# Altium project Custom_Keyboard.PrjPcb (part 1 of 4)
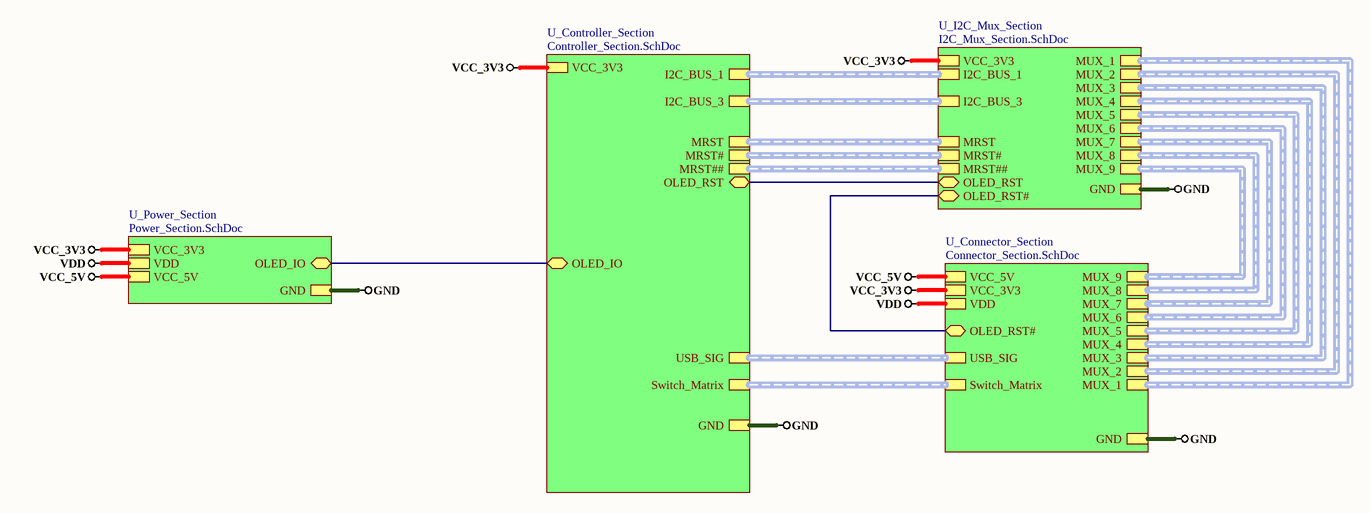
[diagram p0: Top_Sheet.SchDoc]
15 sheets, 298 parts. Net scope: hierarchical (ports join the sheet entries above them; power ports are global).
Board file: Custom_Keyboard.PcbDoc
Sheets:
  Top_Sheet.SchDoc
    U_Controller_Section = Controller_Section.SchDoc
      U_Controller_Section_1 = Controller_Section_1.SchDoc
      U_Controller_Section_2 = Controller_Section_2.SchDoc
    U_Power_Section = Power_Section.SchDoc
    U_Connector_Section = Connector_Section.SchDoc
      U_Connector_Sheet = Connector_Sheet.SchDoc
      U_Connector_Sheet_2 = Connector_Sheet_2.SchDoc
    U_I2C_Mux_Section = I2C_Mux_Section.SchDoc
      U_Mux_Sheet_1 = Mux_Sheet_1.SchDoc
      U_Mux_Sheet_2 = Mux_Sheet_2.SchDoc
      U_RPull_Section = RPull_Section.SchDoc
      U_Rpull_Section2 = Rpull_Section2.SchDoc
      U_Mux_Sheet _3 = Mux_Sheet _3.SchDoc
      U_BufferIC_Section = BufferIC_Section.SchDoc

## Sheet Top_Sheet.SchDoc
size A4; SheetNumber: 1

### Sub-sheets
U_Connector_Section = Connector_Section.SchDoc: USB_SIG (harness USB_SIG), GND, VCC_5V, MUX_1 (harness MUX_1), MUX_2 (harness MUX_2), MUX_3 (harness MUX_3), MUX_4 (harness MUX_4), MUX_5 (harness MUX_5), Switch_Matrix (harness Switch_Matrix), VCC_3V3, VDD, MUX_6 (harness MUX_6), MUX_7 (harness MUX_7), MUX_8 (harness MUX_8), MUX_9 (harness MUX_9), OLED_RST# (bidir)
U_Controller_Section = Controller_Section.SchDoc: USB_SIG (harness USB_SIG), VCC_3V3, GND, I2C_BUS_1 (harness I2C_BUS_1), I2C_BUS_3 (harness I2C_BUS_3), Switch_Matrix (harness Switch_Matrix), OLED_IO (bidir), MRST (harness MRST), MRST# (harness MRST#), MRST## (harness MRST##), OLED_RST (bidir)
U_I2C_Mux_Section = I2C_Mux_Section.SchDoc: VCC_3V3, GND, I2C_BUS_1 (harness I2C_BUS_1), I2C_BUS_3 (harness I2C_BUS_3), MUX_1 (harness MUX_1), MUX_2 (harness MUX_2), MUX_3 (harness MUX_3), MUX_4 (harness MUX_4), MUX_5 (harness MUX_5), MUX_6 (harness MUX_6), MUX_7 (harness MUX_7), MUX_8 (harness MUX_8), MUX_9 (harness MUX_9), MRST (harness MRST), MRST# (harness MRST#), MRST## (harness MRST##), OLED_RST (bidir), OLED_RST# (bidir)
U_Power_Section = Power_Section.SchDoc: VCC_3V3, GND, VCC_5V, OLED_IO (bidir), VDD

### Nets
GND: sheet U_Controller_Section/GND, sheet U_Power_Section/GND, sheet U_Connector_Section/GND, sheet U_I2C_Mux_Section/GND
VCC_3V3: sheet U_Controller_Section/VCC_3V3, sheet U_Power_Section/VCC_3V3, sheet U_Connector_Section/VCC_3V3, sheet U_I2C_Mux_Section/VCC_3V3
VCC_5V: sheet U_Power_Section/VCC_5V, sheet U_Connector_Section/VCC_5V
VDD: sheet U_Power_Section/VDD, sheet U_Connector_Section/VDD
OLED_IO: sheet U_Controller_Section/OLED_IO, sheet U_Power_Section/OLED_IO
OLED_RST: sheet U_Controller_Section/OLED_RST, sheet U_I2C_Mux_Section/OLED_RST
OLED_RST#: sheet U_Connector_Section/OLED_RST#, sheet U_I2C_Mux_Section/OLED_RST#

### Buses and harness runs
harness sheet U_Connector_Section/MUX_1 = sheet U_I2C_Mux_Section/MUX_1
harness sheet U_Connector_Section/MUX_2 = sheet U_I2C_Mux_Section/MUX_2
harness sheet U_Connector_Section/MUX_3 = sheet U_I2C_Mux_Section/MUX_3
harness sheet U_Connector_Section/MUX_4 = sheet U_I2C_Mux_Section/MUX_4
harness sheet U_Connector_Section/MUX_5 = sheet U_I2C_Mux_Section/MUX_5
harness sheet U_Connector_Section/MUX_6 = sheet U_I2C_Mux_Section/MUX_6
harness sheet U_Connector_Section/MUX_7 = sheet U_I2C_Mux_Section/MUX_7
harness sheet U_Connector_Section/MUX_8 = sheet U_I2C_Mux_Section/MUX_8
harness sheet U_Connector_Section/MUX_9 = sheet U_I2C_Mux_Section/MUX_9
harness sheet U_Connector_Section/Switch_Matrix = sheet U_Controller_Section/Switch_Matrix
harness sheet U_Connector_Section/USB_SIG = sheet U_Controller_Section/USB_SIG
harness sheet U_Controller_Section/I2C_BUS_1 = sheet U_I2C_Mux_Section/I2C_BUS_1
harness sheet U_Controller_Section/I2C_BUS_3 = sheet U_I2C_Mux_Section/I2C_BUS_3
harness sheet U_Controller_Section/MRST = sheet U_I2C_Mux_Section/MRST
harness sheet U_Controller_Section/MRST# = sheet U_I2C_Mux_Section/MRST#
harness sheet U_Controller_Section/MRST## = sheet U_I2C_Mux_Section/MRST##

### Notes on the sheet
- 1
- Huzaifa Ali

## Sheet Controller_Section.SchDoc
size A4; SheetNumber: 4
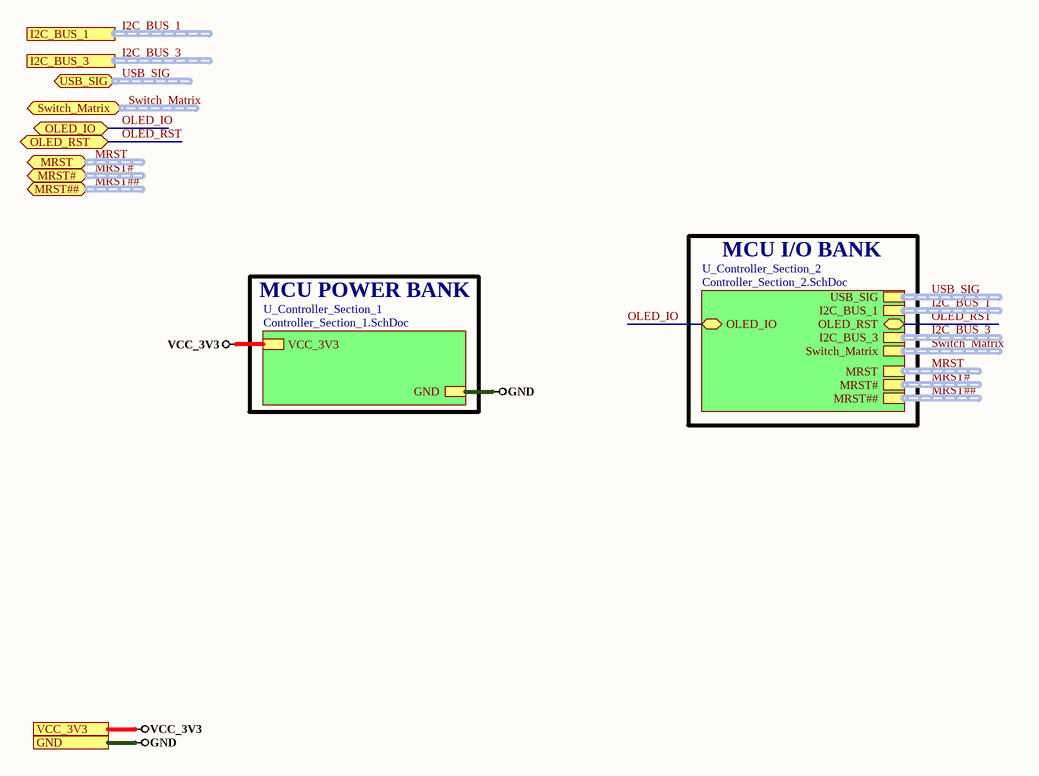
[diagram p1: Controller_Section.SchDoc]

### Sub-sheets
U_Controller_Section_1 = Controller_Section_1.SchDoc: VCC_3V3, GND
U_Controller_Section_2 = Controller_Section_2.SchDoc: USB_SIG (harness USB_SIG), I2C_BUS_1 (harness I2C_BUS_1), I2C_BUS_3 (harness I2C_BUS_3), Switch_Matrix (harness Switch_Matrix), OLED_IO (bidir), MRST (harness MRST), MRST# (harness MRST#), MRST## (harness MRST##), OLED_RST (bidir)

### Ports
GND, I2C_BUS_1 (harness I2C_BUS_1), I2C_BUS_3 (harness I2C_BUS_3), MRST (bidir, harness MRST), MRST# (bidir, harness MRST#), MRST## (bidir, harness MRST##), OLED_IO (bidir), OLED_RST (bidir), Switch_Matrix (bidir, harness Switch_Matrix), USB_SIG (bidir, harness USB_SIG), VCC_3V3

### Nets
GND: port GND, sheet U_Controller_Section_1/GND
VCC_3V3: port VCC_3V3, sheet U_Controller_Section_1/VCC_3V3
OLED_IO: port OLED_IO, sheet U_Controller_Section_2/OLED_IO
OLED_RST: port OLED_RST, sheet U_Controller_Section_2/OLED_RST

### Buses and harness runs
harness I2C_BUS_1 = port I2C_BUS_1
harness I2C_BUS_1 = sheet U_Controller_Section_2/I2C_BUS_1
harness I2C_BUS_3 = port I2C_BUS_3
harness I2C_BUS_3 = sheet U_Controller_Section_2/I2C_BUS_3
harness MRST = port MRST
harness MRST = sheet U_Controller_Section_2/MRST
harness MRST# = port MRST#
harness MRST# = sheet U_Controller_Section_2/MRST#
harness MRST## = port MRST##
harness MRST## = sheet U_Controller_Section_2/MRST##
harness Switch_Matrix = port Switch_Matrix
harness Switch_Matrix = sheet U_Controller_Section_2/Switch_Matrix
harness USB_SIG = port USB_SIG
harness USB_SIG = sheet U_Controller_Section_2/USB_SIG

### Notes on the sheet
- MCU I/O BANK
- MCU POWER BANK
- 1
- Huzaifa Ali

## Sheet Controller_Section_1.SchDoc
size A4; SheetNumber: 3
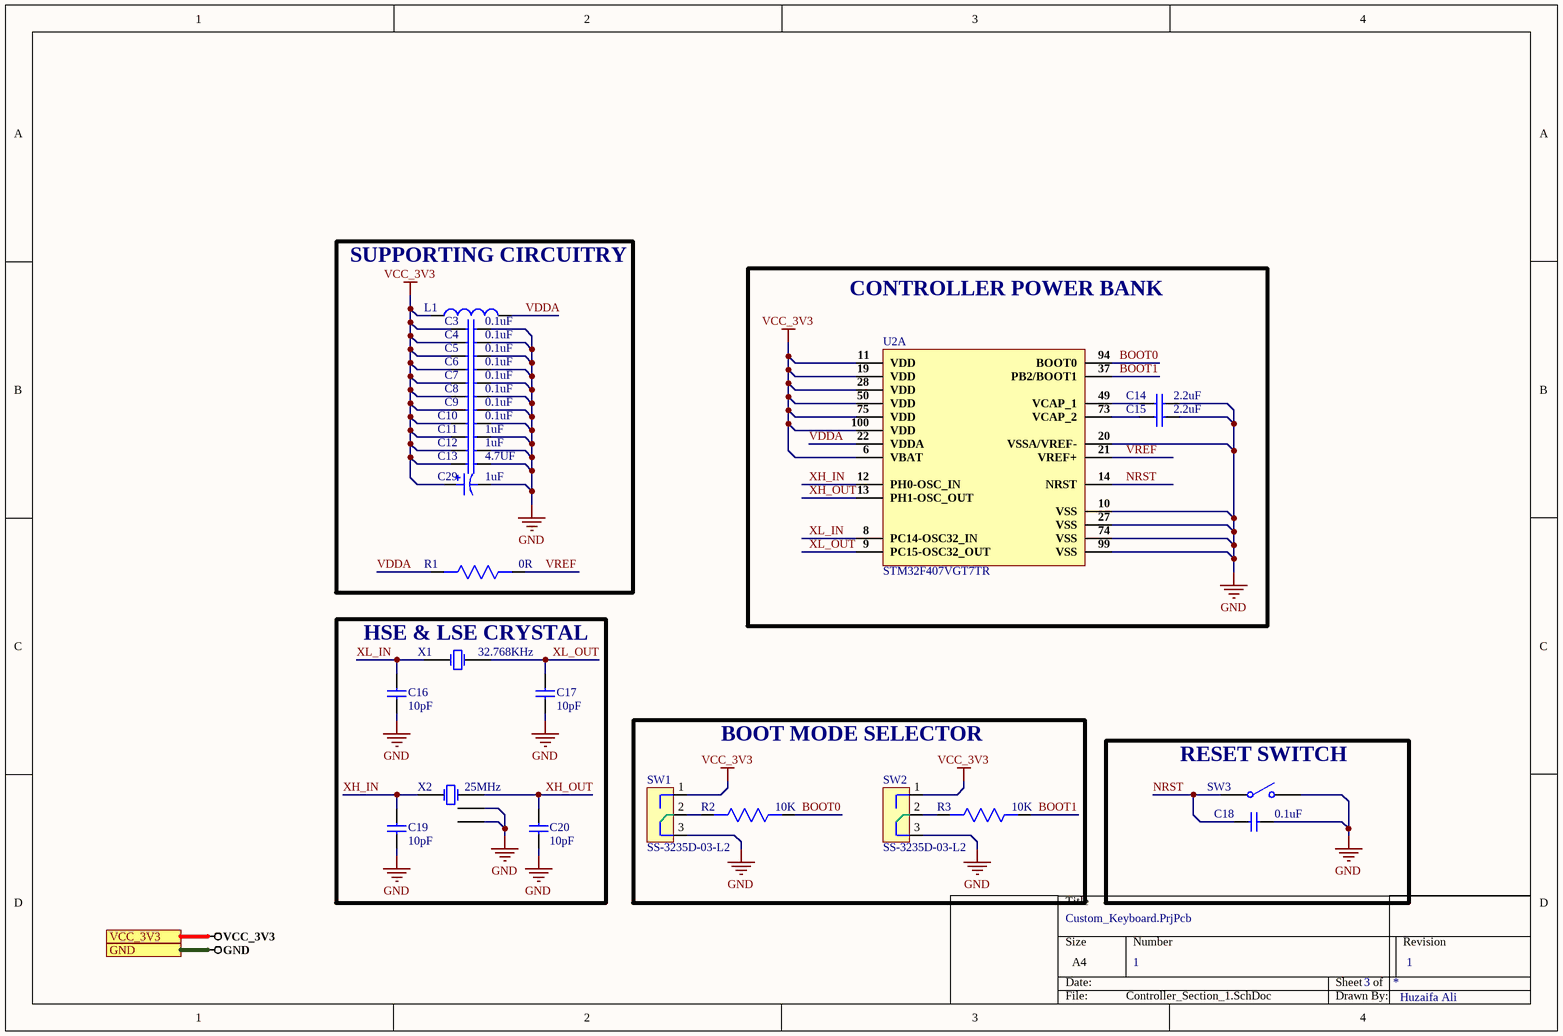
[diagram p2: Controller_Section_1.SchDoc]

### Parts
C3  0.1uF  [Cap0603]
C4  0.1uF  [Cap0603]
C5  0.1uF  [Cap0603]
C6  0.1uF  [Cap0603]
C7  0.1uF  [Cap0603]
C8  0.1uF  [Cap0603]
C9  0.1uF  [Cap0603]
C10  0.1uF  [Cap0603]
C11  1uF  [Cap0603]
C12  1uF  [Cap0603]
C13  4.7UF  [Cap0603]
C14  2.2uF  [Cap0603]
C15  2.2uF  [Cap0603]
C16  10pF  [Cap0603]
C17  10pF  [Cap0603]
C18  0.1uF  [Cap0603]
C19  10pF  [Cap0603]
C20  10pF  [Cap0603]
C29  1uF  [F981E105MMA]
L1  FBMH1608HL121-TV  [IND 0603]  (value not drawn)
R1  0R  [Res-0201]
R2  10K  [Res0603]
R3  10K  [Res0603]
SW1  SS-3235D-03-L2  [SS-3235D-03-L2]
SW2  SS-3235D-03-L2  [SS-3235D-03-L2]
SW3  TS-1185EC-C-D-B  [TS-1185EC-C-D-B]  (value not drawn)
U2  STM32F407VGT7TR  [LQFP-100]  (part A of 4)
X1  32.768KHz  [Q13FC1350000200]
X2  25MHz  [S3225000101040]

### Blocks framed on the sheet
SUPPORTING CIRCUITRY: C3-C13 C29 L1 R1
CONTROLLER POWER BANK: C14 C15 U2
HSE & LSE CRYSTAL: C16 C17 C19 C20 X1 X2
BOOT MODE SELECTOR: R2 R3 SW1 SW2
RESET SWITCH: C18 SW3

### Ports
GND, VCC_3V3

### Nets
GND: C3.2 C4.2 C5.2 C6.2 C7.2 C8.2 C9.2 C10.2 C11.2 C12.2 C13.2 C14.2 C15.2 C16.1 C17.1 C18.2 C19.1 C20.1 C29.2 SW1.3(+) SW2.3(+) SW3.2 U2.10(VSS) U2.20(VSSA/VREF-) U2.27(VSS) U2.74(VSS) U2.99(VSS) X2.2(GND) X2.4(GND) ; port GND
VCC_3V3: C3.1 C4.1 C5.1 C6.1 C7.1 C8.1 C9.1 C10.1 C11.1 C12.1 C13.1 C29.1 L1.1 SW1.1(+) SW2.1(+) U2.6(VBAT) U2.11(VDD) U2.19(VDD) U2.28(VDD) U2.50(VDD) U2.75(VDD) U2.100(VDD) ; port VCC_3V3
BOOT0: R2.1 U2.94(BOOT0)
BOOT1: R3.1 U2.37(PB2/BOOT1)
NRST: C18.1 SW3.1 U2.14(NRST)
VDDA: L1.2 R1.2 U2.22(VDDA)
VREF: R1.1 U2.21(VREF+)
XH_IN: C19.2 U2.12(PH0-OSC_IN) X2.1(OSC1)
XH_OUT: C20.2 U2.13(PH1-OSC_OUT) X2.3(OSC3)
XL_IN: C16.2 U2.8(PC14-OSC32_IN) X1.1(OSC1)
XL_OUT: C17.2 U2.9(PC15-OSC32_OUT) X1.2(OSC2)
NetC14_1: C14.1 U2.49(VCAP_1)
NetC15_1: C15.1 U2.73(VCAP_2)
NetR2_2: R2.2 SW1.2(+)
NetR3_2: R3.2 SW2.2(+)

### Notes on the sheet
- 1
- Huzaifa Ali

### Library data of the parts
C3-C10 C18 = CC0603ZRY5V9BB104: CAP CER 0.1UF 50V Y5V 0603; Manufacturer: Yageo; Capacitance: 100nF; Tolerance: 80%; Supplier 1: Digi-Key; Manufacturer Part Number: CC0603ZRY5V9BB104; Stock 1: 15000880; Pricing 1: 1=0.1, 10=0.075, 100=0.0334, 500=0.02386, 1000=0.01874 (USD); Mount: Surface Mount; Case/Package: 0603; Number of Pins: 2; Case Code (Metric): 1608; Case Code (Imperial): 0603; Min Operating Temperature: -30°C; Max Operating Temperature: 85°C; Dielectric: Y5V; Voltage Rating: 50V; Package Quantity: 1; Packaging: Tape and Reel; Voltage Rating (DC): 50V; Termination: SMD/SMT; Composition: Ceramic; Voltage: 50V; Length: 1.6mm; Height: 0.8mm; Width: 0.031inch; Thickness: 0.035inch; Depth: 0.8mm; Radiation Hardening: No; REACH SVHC: No SVHC; Lead Free: Lead Free; Halogen Free: Halogen Free; ComponentLink1URL: http://www.yageo.com/documents/recent/UPY-GPHC_Y5V_6.3V-to-50V_8.pdf?src-supplier=Digi-Key; ComponentLink1Description: http://www.yageo.com/documents/recent/UPY-GPHC_Y5V_6.3V-to-50V_8.pdf?src-supplier=Digi-Key; ComponentLink2URL: http://www.yageo.com/documents/recent/UPY-GPHC_Y5V_6.3V-to-50V_5.pdf?src-supplier=Avnet+Europe; ComponentLink2Description: http://www.yageo.com/documents/recent/UPY-GPHC_Y5V_6.3V-to-50V_5.pdf?src-supplier=Avnet+Europe; ComponentLink3URL: https://www.verical.com/server-webapp/html/getDatasheet?partID=403611&src-supplier=Verical; ComponentLink3Description: https://www.verical.com/server-webapp/html/getDatasheet?partID=403611&src-supplier=Verical; ComponentLink4URL: http://www.mouser.com/ds/2/447/Yageo_UPY-GP_NP0_16V-to-50V_9-358835.pdf?src-supplier=Mouser; ComponentLink4Description: http://www.mouser.com/ds/2/447/Yageo_UPY-GP_NP0_16V-to-50V_9-358835.pdf?src-supplier=Mouser; ComponentLink5URL: http://www.farnell.com/datasheets/1132289.pdf?src-supplier=Element14; ComponentLink5Description: http://www.farnell.com/datasheets/1132289.pdf?src-supplier=Element14; Supplier Part Number 1: 311-1343-1-ND
C11 C12 = CC0603KRX5R8BB105: CAP CER 1UF 25V X5R 0603; Manufacturer: Yageo; Tolerance: 10%; Supplier 1: Digi-Key; Manufacturer Part Number: CC0603KRX5R8BB105; RoHS: Yes; Category: Ceramic Capacitors; Stock 1: 919939; Pricing 1: 1=0.12000, 10=0.08400, 50=0.04760, 100=0.03940, 500=0.02764, 1000=0.02288 (USD); Mount: Surface Mount; Case/Package: 0603; Number of Pins: 2; Case Code (Metric): 1608; Case Code (Imperial): 0603; Min Operating Temperature: -55°C; Max Operating Temperature: 85°C; Capacitance: 1uF; Dielectric: X5R; Package Quantity: 1; Voltage Rating: 25V; Packaging: Tape and Reel; Termination: SMD/SMT; Voltage Rating (DC): 25V; Series: CC; Construction: Flat; Length: 1.6mm; Width: 0.031inch; Height: 0.8mm; Thickness: 0.035inch; Depth: 0.8mm; Radiation Hardening: No; REACH SVHC: No SVHC; Lead Free: Lead Free; Halogen Free: Halogen Free; RoHS Compliant: Yes; ComponentLink1URL: https://datasheet.ciiva.com/176/mlccorderingcode-176785.pdf?src-supplier=Digi-Key; ComponentLink1Description: https://datasheet.ciiva.com/176/mlccorderingcode-176785.pdf?src-supplier=Digi-Key; ComponentLink2URL: https://datasheet.ciiva.com/176/mlccorderingcode-176786.pdf?src-supplier=Digi-Key; ComponentLink2Description: https://datasheet.ciiva.com/176/mlccorderingcode-176786.pdf?src-supplier=Digi-Key; ComponentLink3URL: https://datasheet.ciiva.com/176/mlccorderingcode-176787.pdf?src-supplier=Digi-Key; ComponentLink3Description: https://datasheet.ciiva.com/176/mlccorderingcode-176787.pdf?src-supplier=Digi-Key; ComponentLink4URL: https://datasheet.ciiva.com/17436/upy-gphc-x5r-4v-to-50v-12-17436952.pdf?src-supplier=Avnet+Europe; ComponentLink4Description: https://datasheet.ciiva.com/17436/upy-gphc-x5r-4v-to-50v-12-17436952.pdf?src-supplier=Avnet+Europe; ComponentLink5URL: https://datasheet.ciiva.com/7978/1525783-7978171.pdf?src-supplier=Element14; ComponentLink5Description: https://datasheet.ciiva.com/7978/1525783-7978171.pdf?src-supplier=Element14; ComponentLink6URL: https://datasheet.ciiva.com/11586/upy-gphc-x5r-4v-to-50v-12-11586318.pdf?src-supplier=Avnet; ComponentLink6Description: https://datasheet.ciiva.com/11586/upy-gphc-x5r-4v-to-50v-12-11586318.pdf?src-supplier=Avnet; Supplier Part Number 1: 311-1445-1-ND
C13 = CL10A475KA8NQNC: CAP CER 4.7UF 25V X5R 0603; Manufacturer: Samsung; Tolerance: 10%; Supplier 1: Digi-Key; Manufacturer Part Number: CL10A475KA8NQNC; Stock 1: 2252340; Pricing 1: 1=0.37, 10=0.255, 100=0.1528, 500=0.11456, 1000=0.09675 (USD); Mount: Surface Mount; Case/Package: 0603; Case Code (Metric): 1608; Case Code (Imperial): 0603; Contact Plating: Tin; Min Operating Temperature: -55°C; Max Operating Temperature: 85°C; Package Quantity: 1; Packaging: Tape and Reel; Capacitance: 4.7uF; Voltage Rating: 25V; Dielectric: X5R; Termination: Wraparound; Length: 1.6mm; Width: 0.031inch; Thickness: 0.035inch; Depth: 0.8mm; Lead Free: Lead Free; ComponentLink1URL: http://www.samsungsem.com/kr/support/product-search/mlcc/CL10A475KA8NQNC.jsp?src-supplier=Digi-Key; ComponentLink1Description: http://www.samsungsem.com/kr/support/product-search/mlcc/CL10A475KA8NQNC.jsp?src-supplier=Digi-Key; Supplier Part Number 1: 1276-1900-1-ND
C14 C15 = GRM188R6YA225KA12D: CAP, 2.2µF, 35V, 10%, X5R, 0603; Manufacturer: Murata; Material: Ceramic; Supplier 1: Digi-Key; Manufacturer Part Number: GRM188R6YA225KA12D; RoHS: Yes; Category: Ceramic Capacitors; Stock 1: 81665; Pricing 1: 1=0.21000, 10=0.14100, 50=0.08480, 100=0.07170, 500=0.04904, 1000=0.04338 (USD); Mount: Surface Mount; Case/Package: 0603; Case Code (Metric): 1608; Case Code (Imperial): 0603; Weight: 0.000222oz; Min Operating Temperature: -55°C; Max Operating Temperature: 85°C; Package Quantity: 4000; Packaging: Tape and Reel; Capacitance: 2.2uF; Tolerance: 10%; Voltage Rating: 35V; Dielectric: X5R; Voltage: 35V; Termination: SMD/SMT; Voltage Rating (DC): 35V; Series: GRM; Length: 1.6mm; Width: 0.8mm; Height: 0.8mm; Thickness: 0.035inch; Depth: 0.8mm; REACH SVHC: No SVHC; Lead Free: Lead Free; RoHS Compliant: Yes; ComponentLink1URL: https://datasheet.ciiva.com/14906/partnumbering-e-01-14906490.pdf?src-supplier=Digi-Key; ComponentLink1Description: https://datasheet.ciiva.com/14906/partnumbering-e-01-14906490.pdf?src-supplier=Digi-Key; ComponentLink2URL: https://datasheet.ciiva.com/14906/partnumbering-e-01-14906491.pdf?src-supplier=Digi-Key; ComponentLink2Description: https://datasheet.ciiva.com/14906/partnumbering-e-01-14906491.pdf?src-supplier=Digi-Key; ComponentLink3URL: https://datasheet.ciiva.com/14906/partnumbering-e-01-14906492.pdf?src-supplier=Digi-Key; ComponentLink3Description: https://datasheet.ciiva.com/14906/partnumbering-e-01-14906492.pdf?src-supplier=Digi-Key; Supplier Part Number 1: 490-7204-1-ND
C16 C17 C19 C20 = CC0603JRNPO9BN100: CAP CER 10PF 50V NP0 0603; Manufacturer: Yageo; Tolerance: 5%; Dielectric: C0G; Temperature Coefficient: 30ppm/°C; Insulation Resistance: 100GR; Supplier 1: Digi-Key; Manufacturer Part Number: CC0603JRNPO9BN100; RoHS: Yes; Category: Ceramic Capacitors; Stock 1: 588987; Pricing 1: 1=0.10000, 10=0.04100, 50=0.02220, 100=0.01810, 500=0.01296, 1000=0.01018 (USD); Mount: Surface Mount; Case/Package: 0603; Number of Pins: 2; Case Code (Metric): 1608; Case Code (Imperial): 0603; Min Operating Temperature: -55°C; Max Operating Temperature: 125°C; Capacitance: 10pF; Voltage: 50V; Voltage Rating: 50V; Voltage Rating (DC): 50V; Packaging: Tape and Reel; Package Quantity: 1; Termination: SMD/SMT; Resistor Type: Ceramic; Series: CC; Length: 1.6mm; Width: 0.031inch; Height: 0.8mm; Thickness: 0.035inch; Depth: 0.8mm; Radiation Hardening: No; RoHS Compliant: Yes; REACH SVHC: No SVHC; Lead Free: Lead Free; ComponentLink1URL: https://datasheet.ciiva.com/5789/1734582-5789616.pdf?src-supplier=Farnell; ComponentLink1Description: https://datasheet.ciiva.com/5789/1734582-5789616.pdf?src-supplier=Farnell; ComponentLink2URL: https://datasheet.ciiva.com/26862/getdatasheetpartid-403524-26862758.pdf?src-supplier=Verical; ComponentLink2Description: https://datasheet.ciiva.com/26862/getdatasheetpartid-403524-26862758.pdf?src-supplier=Verical; ComponentLink3URL: https://datasheet.ciiva.com/11786/0900766b8079c870-11786407.pdf?src-supplier=RSComponents; ComponentLink3Description: https://datasheet.ciiva.com/11786/0900766b8079c870-11786407.pdf?src-supplier=RSComponents; ComponentLink4URL: https://datasheet.ciiva.com/144/mlccorderingcode-144651.pdf?src-supplier=Digi-Key; ComponentLink4Description: https://datasheet.ciiva.com/144/mlccorderingcode-144651.pdf?src-supplier=Digi-Key; ComponentLink5URL: https://datasheet.ciiva.com/46430/1835847-46430150.pdf?src-supplier=Element14; ComponentLink5Description: https://datasheet.ciiva.com/46430/1835847-46430150.pdf?src-supplier=Element14; ComponentLink6URL: https://datasheet.ciiva.com/144/mlccorderingcode-144649.pdf?src-supplier=Digi-Key; ComponentLink6Description: https://datasheet.ciiva.com/144/mlccorderingcode-144649.pdf?src-supplier=Digi-Key; ComponentLink7URL: https://datasheet.ciiva.com/144/mlccorderingcode-144650.pdf?src-supplier=Digi-Key; ComponentLink7Description: https://datasheet.ciiva.com/144/mlccorderingcode-144650.pdf?src-supplier=Digi-Key; ComponentLink8URL: https://datasheet.ciiva.com/8033/1734582-8033706.pdf?src-supplier=Element14; ComponentLink8Description: https://datasheet.ciiva.com/8033/1734582-8033706.pdf?src-supplier=Element14; ComponentLink9URL: https://datasheet.ciiva.com/16625/upy-gp-np0-16v-to-50v-8-16625514.pdf?src-supplier=Avnet+Europe; ComponentLink9Description: https://datasheet.ciiva.com/16625/upy-gp-np0-16v-to-50v-8-16625514.pdf?src-supplier=Avnet+Europe; ComponentLink10URL: https://datasheet.ciiva.com/5425/upy-gp-np0-16v-to-50v-8-5425564.pdf?src-supplier=Mouser; ComponentLink10Description: https://datasheet.ciiva.com/5425/upy-gp-np0-16v-to-50v-8-5425564.pdf?src-supplier=Mouser; ComponentLink11URL: https://datasheet.ciiva.com/7978/1132289-7978126.pdf?src-supplier=Element14; ComponentLink11Description: https://datasheet.ciiva.com/7978/1132289-7978126.pdf?src-supplier=Element14; ComponentLink12URL: https://datasheet.ciiva.com/8033/1734582-8033710.pdf?src-supplier=Element14; ComponentLink12Description: https://datasheet.ciiva.com/8033/1734582-8033710.pdf?src-supplier=Element14; Supplier Part Number 1: 311-1058-1-ND
C29 = F981E105MMA: CAP TANT 1UF 20% 25V 0603; Manufacturer: Kyocera AVX; ESR (Equivalent Series Resistance): 10R; Supplier 1: Digi-Key; Manufacturer Part Number: F981E105MMA; RoHS: Yes; Category: Tantalum Capacitors; Stock 1: 11167; Pricing 1: 1=0.79000, 10=0.55800, 50=0.42220, 100=0.36770, 500=0.27236, 1000=0.23151 (USD); Mount: Surface Mount; Case/Package: 0603; Min Operating Temperature: -55°C; Max Operating Temperature: 125°C; Features: General Purpose; Packaging: Tape and Reel; Capacitance: 1uF; Tolerance: 20%; Voltage Rating: 25V; RoHS Compliant: Yes; ComponentLink1URL: http://www.mouser.com/ds/2/40/f98-775787.pdf?src-supplier=Mouser; ComponentLink1Description: http://www.mouser.com/ds/2/40/f98-775787.pdf?src-supplier=Mouser; ComponentLink2URL: http://www.farnell.com/datasheets/2096554.pdf?src-supplier=Newark; ComponentLink2Description: http://www.farnell.com/datasheets/2096554.pdf?src-supplier=Newark; ComponentLink3URL: http://datasheets.avx.com/F98.pdf?src-supplier=Digi-Key; ComponentLink3Description: http://datasheets.avx.com/F98.pdf?src-supplier=Digi-Key; Supplier Part Number 1: 478-8658-1-ND
L1 = FBMH1608HL121-TV: Ferrite Beads 120Ohm 25% 100MHz 1.2A 0.13Ohm DCR 0603 Automotive T/R; Manufacturer: Taiyo Yuden; Impedance: 120R; Number of Lines: 1; DC Resistance (DCR): 130mR; Max DC Current: 900mA; Supplier 1: Avnet; Manufacturer Part Number: FBMH1608HL121-TV; RoHS: Yes; Category: Ferrite Beads and Chips; Pricing 1: 4000=0.05939, 8000=0.05429, 16000=0.05185, 24000=0.04942, 32000=0.04698 (USD); Mount: Surface Mount; Case/Package: 0603; Core Material: Ferrite; Case Code (Metric): 1608; Case Code (Imperial): 0603; Weight: 7.1E-05oz; Min Operating Temperature: -40°C; Max Operating Temperature: 125°C; Tolerance: 25%; Package Quantity: 4000; Packaging: Tape and Reel; Max Current Rating: 1.2A; Termination: SMD/SMT; Test Frequency: 100MHz; Length: 0.063inch; Width: 0.8mm; Height: 0.8mm; Ratings: AEC-Q200; RoHS Compliant: Yes; ComponentLink1URL: http://www.mouser.com/ds/2/396/chipbeads01_e-559265.pdf?src-supplier=Mouser; ComponentLink1Description: http://www.mouser.com/ds/2/396/chipbeads01_e-559265.pdf?src-supplier=Mouser; ComponentLink2URL: http://ds.yuden.co.jp/TYCOMPAS/ut/detail.do?productNo=FBMH1608HL121-TV&fileName=FBMH1608HL121-TV_SS&mode=specSheetDownload&src-supplier=Digi-Key; ComponentLink2Description: http://ds.yuden.co.jp/TYCOMPAS/ut/detail.do?productNo=FBMH1608HL121-TV&fileName=FBMH1608HL121-TV_SS&mode=specSheetDownload&src-supplier=Digi-Key; ComponentLink3URL: https://www.yuden.co.jp/ut/product/category/emisuppression/FBMH1608HL121-TV_SS.pdf?src-supplier=Avnet; ComponentLink3Description: https://www.yuden.co.jp/ut/product/category/emisuppression/FBMH1608HL121-TV_SS.pdf?src-supplier=Avnet; Supplier Part Number 1: FBMH1608HL121-TV
R1 = RC0201JR-070RL: RES SMD 0 OHM JUMPER 1/20W 0201; Manufacturer: Yageo; Power Rating: 50mW; Tolerance: 5%; Voltage Rating: 25V; Supplier 1: Digi-Key; Manufacturer Part Number: RC0201JR-070RL; RoHS: Yes; Category: Chip SMD Resistors; Stock 1: 11079; Pricing 1: 1=0.10000, 10=0.03600, 25=0.02640, 50=0.02000, 100=0.01480, 250=0.01128, 500=0.00904, 1000=0.00665, 5000=0.00477 (USD); Case/Package: 0201; Contact Plating: Tin,Matte; Case Code (Metric): 0603; Case Code (Imperial): 0201; Weight: 6E-06oz; Size Code: 0201; Min Operating Temperature: -55°C; Max Operating Temperature: 125°C; Resistor Type: Thick Film; Resistance: 0R; Packaging: Tape and Reel; Package Quantity: 10000; Number of Terminations: 2; Termination: SMD/SMT; Max Power Dissipation: 50mW; Voltage Rating (DC): 25V; Features: Moisture Resistant; Series: RC; Construction: Rectangular; Resistance Tolerance: 5%; Length: 0.6mm; Width: 0.012inch; Height: 0.01inch; Depth: 0.3mm; Radiation Hardening: No; RoHS Compliant: Yes; REACH SVHC: Unknown; Military Standard: Not; Lead Free: Lead Free; ComponentLink1URL: https://datasheet.ciiva.com/7672/1563626-7672247.pdf?src-supplier=Element14; ComponentLink1Description: https://datasheet.ciiva.com/7672/1563626-7672247.pdf?src-supplier=Element14; ComponentLink2URL: https://datasheet.ciiva.com/7660/1421516-7660808.pdf?src-supplier=Element14; ComponentLink2Description: https://datasheet.ciiva.com/7660/1421516-7660808.pdf?src-supplier=Element14; ComponentLink3URL: https://datasheet.ciiva.com/7672/1563626-7672248.pdf?src-supplier=Element14; ComponentLink3Description: https://datasheet.ciiva.com/7672/1563626-7672248.pdf?src-supplier=Element14; ComponentLink4URL: https://datasheet.ciiva.com/16855/pyu-rc0201-51-rohs-l-8-16855994.pdf?src-supplier=Avnet+Europe; ComponentLink4Description: https://datasheet.ciiva.com/16855/pyu-rc0201-51-rohs-l-8-16855994.pdf?src-supplier=Avnet+Europe; ComponentLink5URL: https://datasheet.ciiva.com/28419/pyu-rc0201-51-rohs-l-8-28419660.pdf?src-supplier=Avnet+Europe; ComponentLink5Description: https://datasheet.ciiva.com/28419/pyu-rc0201-51-rohs-l-8-28419660.pdf?src-supplier=Avnet+Europe; ComponentLink6URL: https://datasheet.ciiva.com/46391/1421516-46391340.pdf?src-supplier=Element14; ComponentLink6Description: https://datasheet.ciiva.com/46391/1421516-46391340.pdf?src-supplier=Element14; ComponentLink7URL: https://datasheet.ciiva.com/8896/pyu-rc0201-51-rohs-l-8-8896143.pdf?src-supplier=Avnet; ComponentLink7Description: https://datasheet.ciiva.com/8896/pyu-rc0201-51-rohs-l-8-8896143.pdf?src-supplier=Avnet; Supplier Part Number 1: 311-0.0NCT-ND
R2 R3 = AC0603JR-0710KL: RES SMD 10K OHM 5% 1/10W 0603; Manufacturer: Yageo; Voltage Rating: 50V; Resistance: 10kR; Power Rating: 100mW; Temperature Coefficient: 100ppm/°C; Supplier 1: Future Electronics; Manufacturer Part Number: AC0603JR-0710KL; RoHS: Yes; Category: Chip SMD Resistors; Stock 1: 1533000; Pricing 1: 5000=0.00540 (USD); Case/Package: 0603; Case Code (Imperial): 0603; Case Code (Metric): 1608; Size Code: 0603; Min Operating Temperature: -55°C; Max Operating Temperature: 155°C; Packaging: Tape and Reel; Tolerance: 5%; Package Quantity: 1; Resistor Type: Thick Film; Termination: SMD/SMT; Number of Terminations: 2; Max Power Dissipation: 100mW; Features: Moisture Resistant,Automotive AEC-Q200,Anti-Sulfur; Series: AC; Construction: Rectangular; Length: 0.063inch; Width: 0.031inch; Height: 0.022inch; Depth: 0.8mm; Military Standard: Not; Lead Free: Lead Free; RoHS Compliant: Yes; ComponentLink1URL: https://datasheet.ciiva.com/5562/pyu-ac-51-rohs-l-2-5562553.pdf?src-supplier=Mouser; ComponentLink1Description: https://datasheet.ciiva.com/5562/pyu-ac-51-rohs-l-2-5562553.pdf?src-supplier=Mouser; Supplier Part Number 1: 1029044
SW1 SW2 = SS-3235D-03-L2: SPDT 50mA @ 12VDC 12V On-On SMD Toggle Switches RoHS; Manufacturer: XKB Connectivity; Actuator Orientation: Vertical; Switch Height: 3mm; Actuator Type: Standard; Electrical Life Cycles: 10000; Operating Force: 200±100gf; Package: SMD; Circuit: SPDT; Contact Rating @ Voltage: 50mA @ 12VDC; Rated Voltage(DC): 12V; Mounting Type: Surface Mount; Contact Material: Brass; Contact Finish: Silver
SW3 = TS-1185EC-C-D-B: 3mm 2mm Round Button 50mA Top3.65mm SPST 12V SMD Tactile Switches; Manufacturer: XKB; Manufacturer Part No: TS-1185EC-C-D-B; Package: Custom; ComponentLink1Description: LCSC; ComponentLink1URL: https://lcsc.com/product-detail/Tactile-Switches_XKB-Connectivity-TS-1185EC-C-D-B_C318893.html
U2 = STM32F407VGT7TR: IC MCU 32BIT 1MB FLASH 100LQFP; Manufacturer: STMicroelectronics; RAM Size: 196KB; Max Power Dissipation: 465mW; Interface: I2C,SPI,USB,CAN,Ethernet,IrDA,UART,USART,LIN,EBI/EMI,I2S; Number of I/Os: 82; Number of Timers/Counters: 14; Frequency: 168MHz; Oscillator Type: Internal; Data Bus Width: 32b; Watchdog Timer: Yes; Peripherals: Brown-out Detect/Reset,POR,PWM,WDT,DMA,LCD; Core Architecture: ARM; Supplier 1: Avnet; Manufacturer Part Number: STM32F407VGT7TR; RoHS: Yes; Category: Microcontrollers; Pricing 1: 1000=8.54203, 2000=8.32301, 4000=8.19785, 6000=8.07269, 8000=7.97882, 10000=7.82238, 100000=7.69722 (USD); Case/Package: LQFP; Number of Pins: 100; Min Operating Temperature: -40°C; Max Operating Temperature: 105°C; Packaging: Tape and Reel; Number of Programmable I/O: 82; Max Frequency: 168MHz; Memory Type: FLASH; Memory Size: 1MB; Radiation Hardening: No; RoHS Compliant: Yes; ComponentLink1URL: https://datasheet.ciiva.com/48494/dm00037051-48494023.pdf?src-supplier=Avnet; ComponentLink1Description: https://datasheet.ciiva.com/48494/dm00037051-48494023.pdf?src-supplier=Avnet; Supplier Part Number 1: STM32F407VGT7TR
X1 = Q13FC1350000200: 32.768kHz SMD Crystal Resonator 7pF 70kΩ ±20ppm; Manufacturer: Seiko Epson; Frequency: 32.768kHz; Crystal Type: SMD Crystal Resonator; Load Capacitance: 7pF; Equivalent Series Resistance (ESR): 70kΩ
X2 = S3225000101040: 25MHz SMD Crystal Resonator 10pF 40Ω ±10ppm; Manufacturer: JGHC; Frequency: 25MHz; Crystal Type: SMD Crystal Resonator; Load Capacitance: 10pF; Equivalent Series Resistance (ESR): 40Ω

## Sheet Controller_Section_2.SchDoc
size A4; SheetNumber: 7
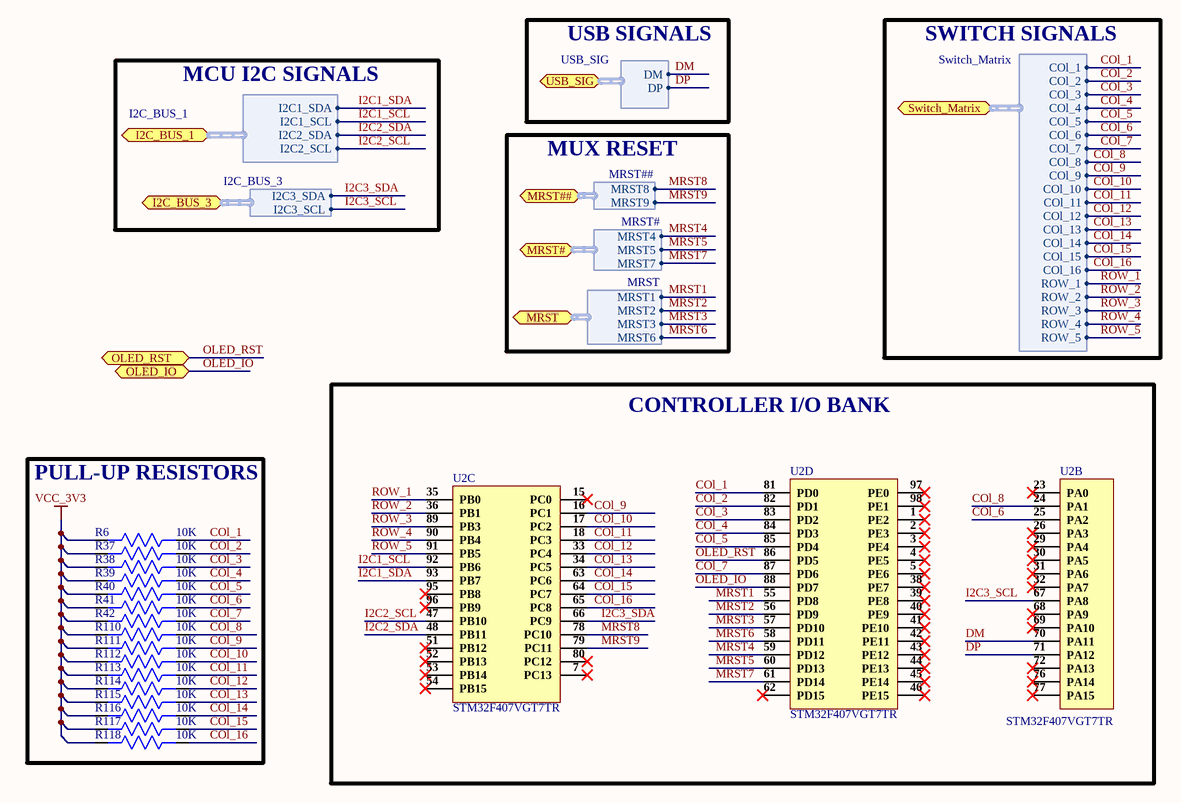
[diagram p3: Controller_Section_2.SchDoc]

### Parts
R6  10K  [Res0603]
R37  10K  [Res0603]
R38  10K  [Res0603]
R39  10K  [Res0603]
R40  10K  [Res0603]
R41  10K  [Res0603]
R42  10K  [Res0603]
R110  10K  [Res0603]
R111  10K  [Res0603]
R112  10K  [Res0603]
R113  10K  [Res0603]
R114  10K  [Res0603]
R115  10K  [Res0603]
R116  10K  [Res0603]
R117  10K  [Res0603]
R118  10K  [Res0603]
U2  STM32F407VGT7TR  [LQFP-100]  (parts B,C,D of 4)

### Blocks framed on the sheet
CONTROLLER I/O BANK: U2
PULL-UP RESISTORS: R6 R37-R42 R110-R118

### Ports
I2C_BUS_1 (bidir, harness I2C_BUS_1), I2C_BUS_3 (bidir, harness I2C_BUS_3), MRST (bidir, harness MRST), MRST# (bidir, harness MRST#), MRST## (bidir, harness MRST##), OLED_IO (bidir), OLED_RST (bidir), Switch_Matrix (bidir, harness Switch_Matrix), USB_SIG (bidir, harness USB_SIG)

### Harnesses
USB_SIG: DM, DP
I2C_BUS_1: I2C2_SDA, I2C1_SCL, I2C1_SDA, I2C2_SCL
I2C_BUS_3: I2C3_SDA, I2C3_SCL
Switch_Matrix: COl_1, COl_2, COl_3, COl_4, COl_5, COl_6, COl_7, ROW_1, ROW_2, ROW_3, ROW_4, ROW_5, COl_8, COl_9, COl_10, COl_11, COl_12, COl_13, COl_14, COl_15, COl_16
MRST##: MRST8, MRST9
MRST#: MRST4, MRST5, MRST7
MRST: MRST1, MRST2, MRST3, MRST6

### Nets
VCC_3V3: R6.2 R37.2 R38.2 R39.2 R40.2 R41.2 R42.2 R110.2 R111.2 R112.2 R113.2 R114.2 R115.2 R116.2 R117.2 R118.2
COl_1: R6.1 U2.81(PD0) ; port Switch_Matrix.COl_1
COl_2: R37.1 U2.82(PD1) ; port Switch_Matrix.COl_2
COl_3: R38.1 U2.83(PD2) ; port Switch_Matrix.COl_3
COl_4: R39.1 U2.84(PD3) ; port Switch_Matrix.COl_4
COl_5: R40.1 U2.85(PD4) ; port Switch_Matrix.COl_5
COl_6: R41.1 U2.25(PA2) ; port Switch_Matrix.COl_6
COl_7: R42.1 U2.87(PD6) ; port Switch_Matrix.COl_7
COl_8: R110.1 U2.24(PA1) ; port Switch_Matrix.COl_8
COl_9: R111.1 U2.16(PC1) ; port Switch_Matrix.COl_9
COl_10: R112.1 U2.17(PC2) ; port Switch_Matrix.COl_10
COl_11: R113.1 U2.18(PC3) ; port Switch_Matrix.COl_11
COl_12: R114.1 U2.33(PC4) ; port Switch_Matrix.COl_12
COl_13: R115.1 U2.34(PC5) ; port Switch_Matrix.COl_13
COl_14: R116.1 U2.63(PC6) ; port Switch_Matrix.COl_14
COl_15: R117.1 U2.64(PC7) ; port Switch_Matrix.COl_15
COl_16: R118.1 U2.65(PC8) ; port Switch_Matrix.COl_16
DM: U2.70(PA11) ; port USB_SIG.DM
DP: U2.71(PA12) ; port USB_SIG.DP
I2C1_SCL: U2.92(PB6) ; port I2C_BUS_1.I2C1_SCL
I2C1_SDA: U2.93(PB7) ; port I2C_BUS_1.I2C1_SDA
I2C2_SCL: U2.47(PB10) ; port I2C_BUS_1.I2C2_SCL
I2C2_SDA: U2.48(PB11) ; port I2C_BUS_1.I2C2_SDA
I2C3_SCL: U2.67(PA8) ; port I2C_BUS_3.I2C3_SCL
I2C3_SDA: U2.66(PC9) ; port I2C_BUS_3.I2C3_SDA
MRST1: U2.55(PD8) ; port MRST.MRST1  [project net MRST.MRST1]
MRST2: U2.56(PD9) ; port MRST.MRST2  [project net MRST.MRST2]
MRST3: U2.57(PD10) ; port MRST.MRST3  [project net MRST.MRST3]
MRST4: U2.59(PD12) ; port MRST#.MRST4  [project net MRST#.MRST4]
MRST5: U2.60(PD13) ; port MRST#.MRST5  [project net MRST#.MRST5]
MRST6: U2.58(PD11) ; port MRST.MRST6  [project net MRST.MRST6]
MRST7: U2.61(PD14) ; port MRST#.MRST7  [project net MRST#.MRST7]
MRST8: U2.78(PC10) ; port MRST##.MRST8  [project net MRST##.MRST8]
MRST9: U2.79(PC11) ; port MRST##.MRST9  [project net MRST##.MRST9]
OLED_IO: U2.88(PD7) ; port OLED_IO
OLED_RST: U2.86(PD5) ; port OLED_RST
ROW_1: U2.35(PB0) ; port Switch_Matrix.ROW_1
ROW_2: U2.36(PB1) ; port Switch_Matrix.ROW_2
ROW_3: U2.89(PB3) ; port Switch_Matrix.ROW_3
ROW_4: U2.90(PB4) ; port Switch_Matrix.ROW_4
ROW_5: U2.91(PB5) ; port Switch_Matrix.ROW_5

Not connected (* = marked no-connect by the designer): U2 1(PE2)* 2(PE3)* 3(PE4)* 4(PE5)* 5(PE6)* 7(PC13)* 15(PC0)* 23(PA0)* 26(PA3)* 29(PA4)* 30(PA5)* 31(PA6)* 32(PA7)* 38(PE7)* 39(PE8)* 40(PE9)* 41(PE10)* 42(PE11)* 43(PE12)* 44(PE13)* 45(PE14)* 46(PE15)* 51(PB12)* 52(PB13)* 53(PB14)* 54(PB15)* 62(PD15)* 68(PA9)* 69(PA10)* 72(PA13)* 76(PA14)* 77(PA15)* 80(PC12)* 95(PB8)* 96(PB9)* 97(PE0)* 98(PE1)*

### Notes on the sheet
- USB SIGNALS
- SWITCH SIGNALS
- MCU I2C SIGNALS
- MUX RESET
- 1
- Huzaifa Ali

### Library data of the parts
R6 R37-R42 R110-R118 = AC0603JR-0710KL: as R2 on sheet Controller_Section_1; Supplier 1: Future Electronics; Manufacturer Part Number: AC0603JR-0710KL; RoHS: Yes; Category: Chip SMD Resistors; Stock 1: 1533000; Pricing 1: 5000=0.00540 (USD); Case/Package: 0603; Case Code (Imperial): 0603; Case Code (Metric): 1608; Size Code: 0603; Min Operating Temperature: -55°C; Max Operating Temperature: 155°C; Packaging: Tape and Reel; Tolerance: 5%; Package Quantity: 1; Resistor Type: Thick Film; Termination: SMD/SMT; Number of Terminations: 2; Max Power Dissipation: 100mW; Features: Moisture Resistant,Automotive AEC-Q200,Anti-Sulfur; Series: AC; Construction: Rectangular; Length: 0.063inch; Width: 0.031inch; Height: 0.022inch; Depth: 0.8mm; Military Standard: Not; Lead Free: Lead Free; RoHS Compliant: Yes; ComponentLink1URL: https://datasheet.ciiva.com/5562/pyu-ac-51-rohs-l-2-5562553.pdf?src-supplier=Mouser; ComponentLink1Description: https://datasheet.ciiva.com/5562/pyu-ac-51-rohs-l-2-5562553.pdf?src-supplier=Mouser; Supplier Part Number 1: 1029044
U2 = STM32F407VGT7TR: as U2 on sheet Controller_Section_1; Supplier 1: Avnet; Manufacturer Part Number: STM32F407VGT7TR; RoHS: Yes; Category: Microcontrollers; Pricing 1: 1000=8.54203, 2000=8.32301, 4000=8.19785, 6000=8.07269, 8000=7.97882, 10000=7.82238, 100000=7.69722 (USD); Case/Package: LQFP; Number of Pins: 100; Min Operating Temperature: -40°C; Max Operating Temperature: 105°C; Packaging: Tape and Reel; Number of Programmable I/O: 82; Max Frequency: 168MHz; Memory Type: FLASH; Memory Size: 1MB; Radiation Hardening: No; RoHS Compliant: Yes; ComponentLink1URL: https://datasheet.ciiva.com/48494/dm00037051-48494023.pdf?src-supplier=Avnet; ComponentLink1Description: https://datasheet.ciiva.com/48494/dm00037051-48494023.pdf?src-supplier=Avnet; Supplier Part Number 1: STM32F407VGT7TR